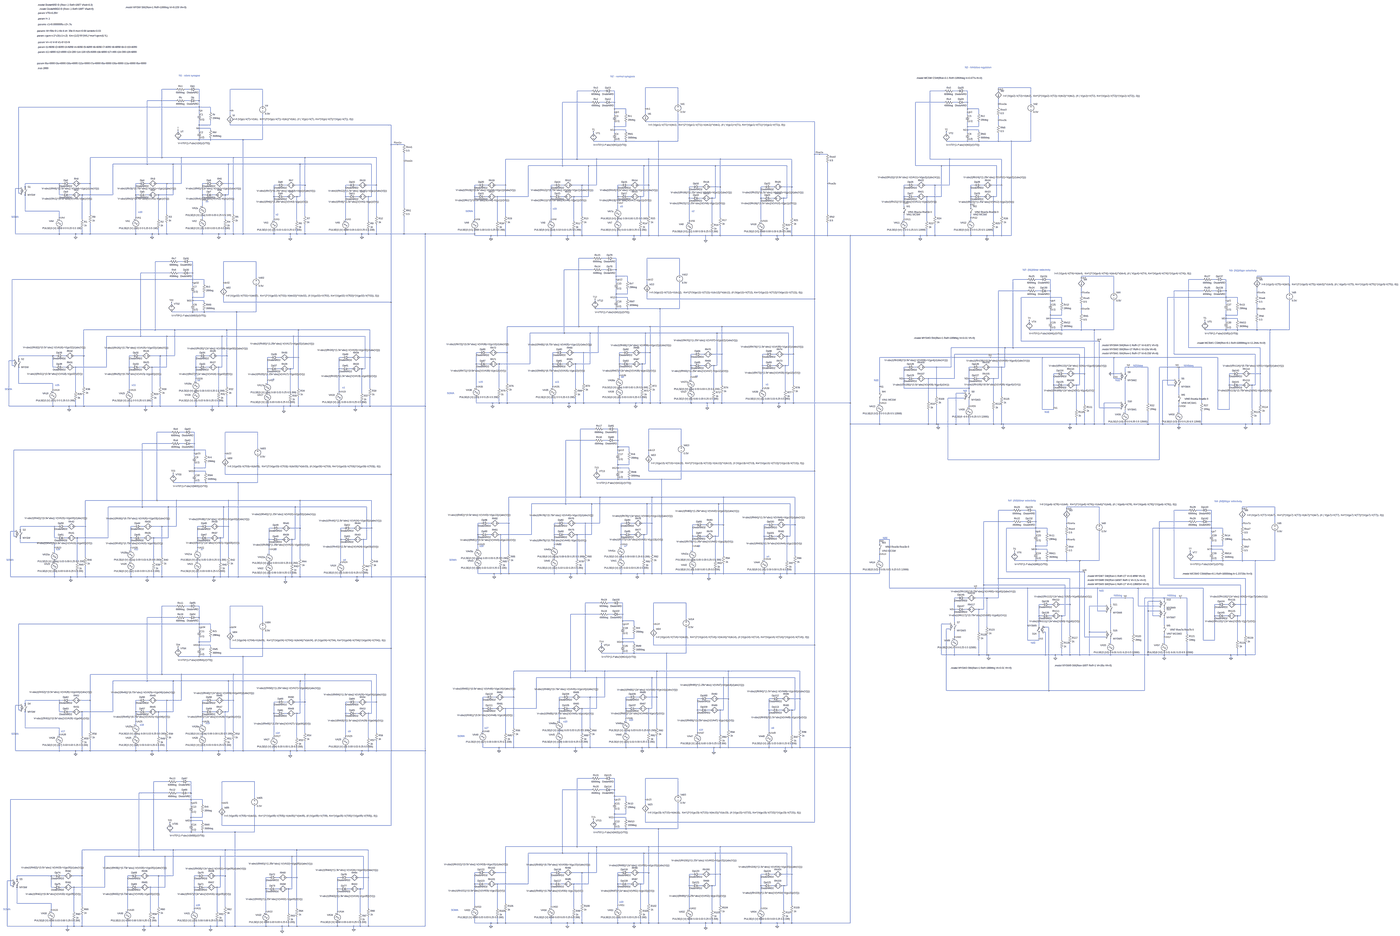
[diagram p0: schematic NC1_240deg_Diamond.asc, whole sheet]
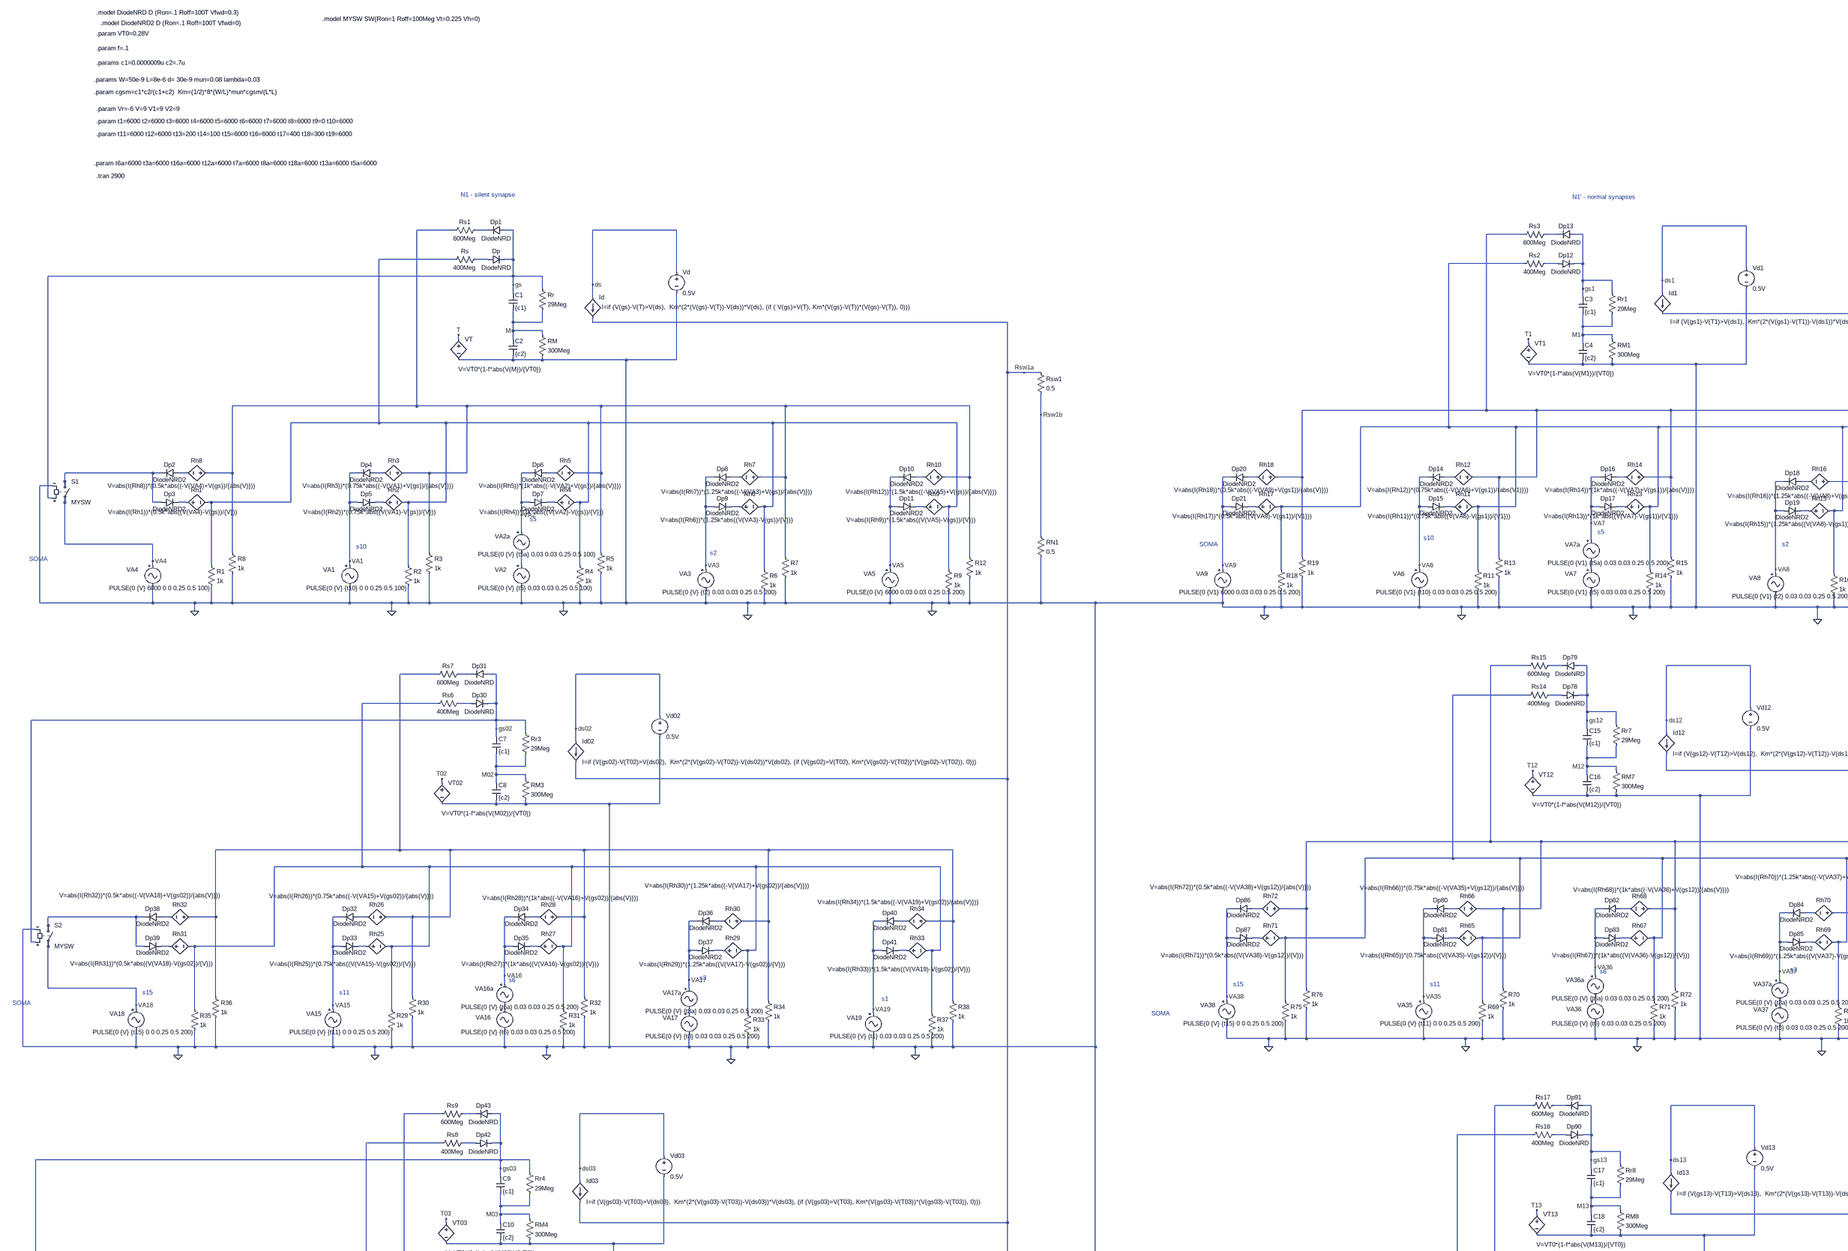
[diagram p1: schematic NC1_240deg_Diamond.asc, part, row 1 of 2, column 1 of 2]
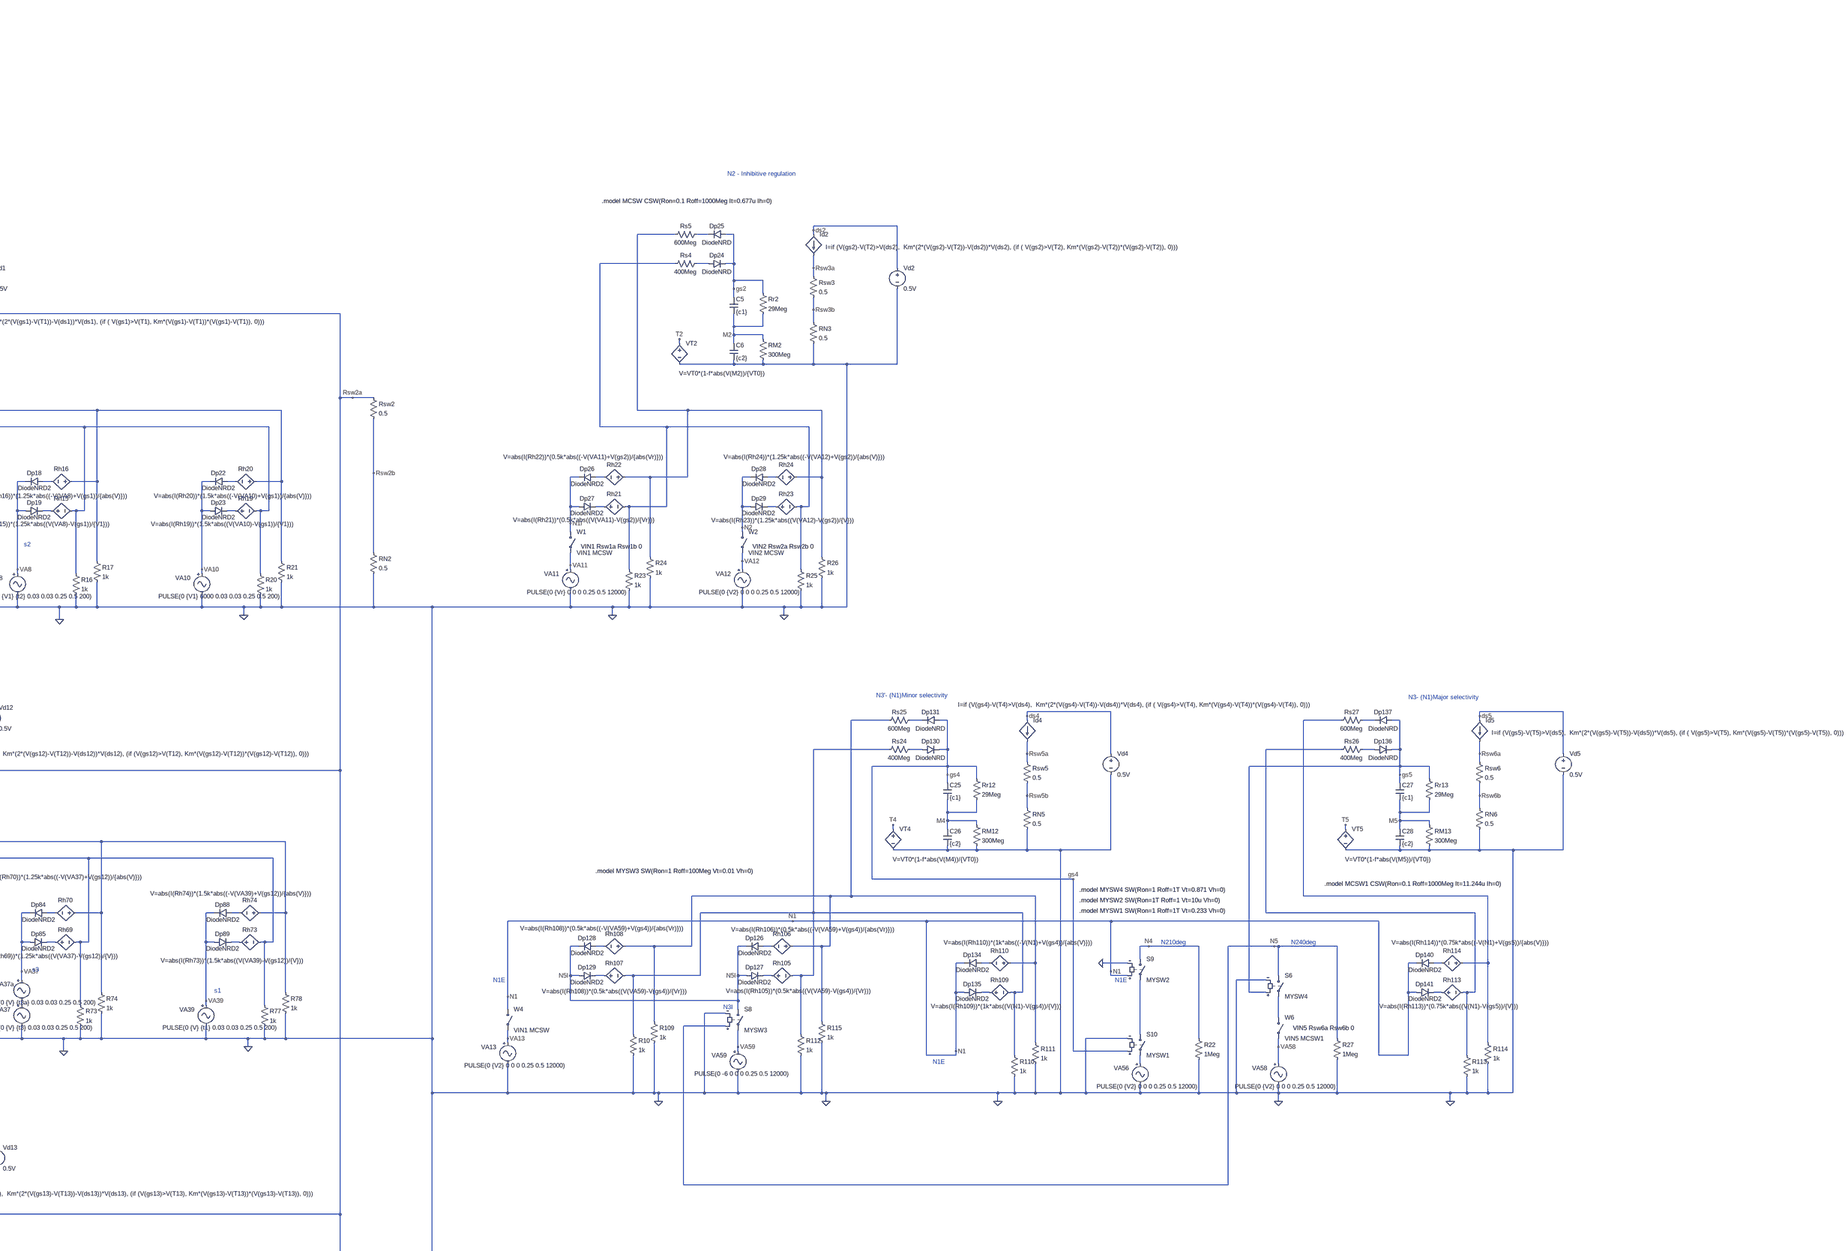
[diagram p2: schematic NC1_240deg_Diamond.asc, part, row 1 of 2, column 2 of 2]
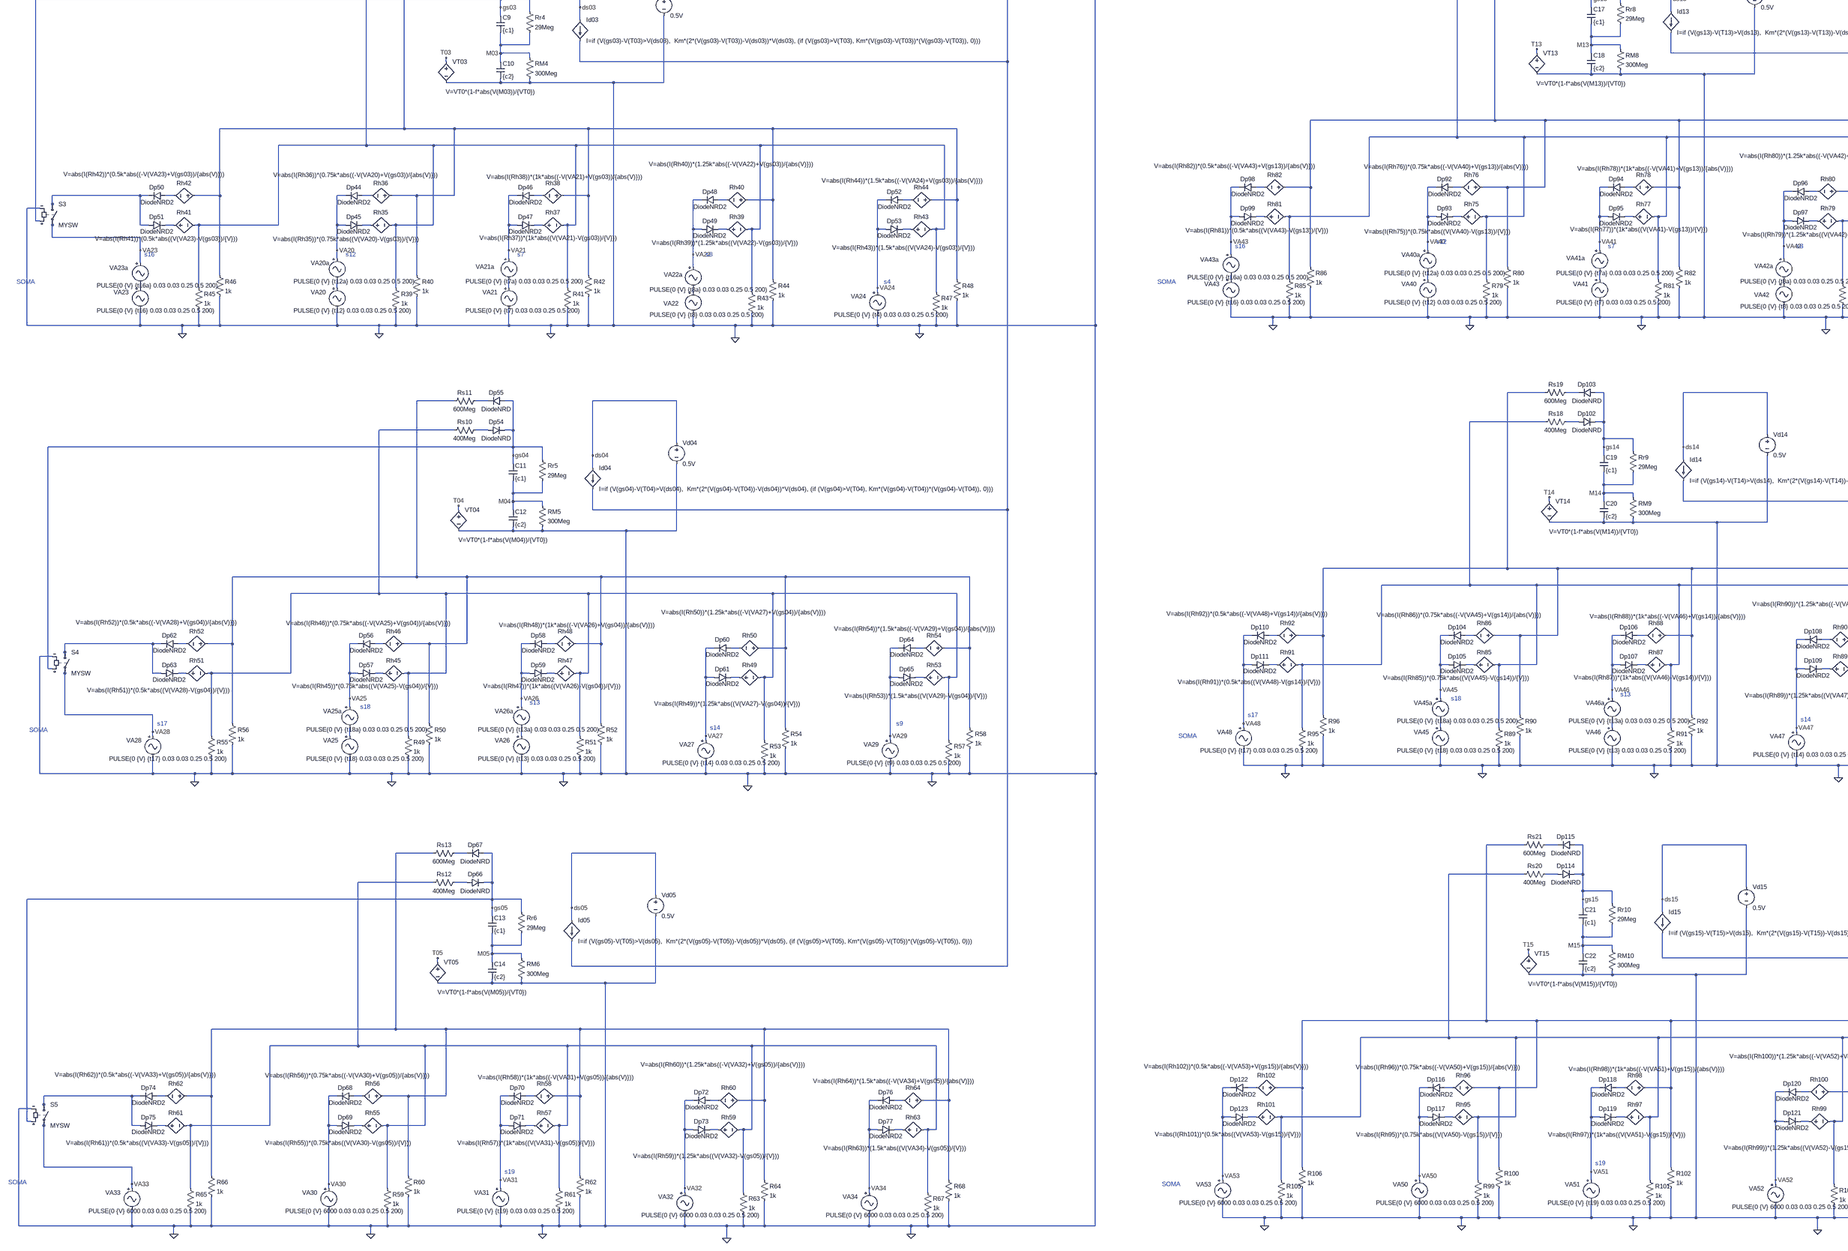
[diagram p3: schematic NC1_240deg_Diamond.asc, part, row 2 of 2, column 1 of 2]
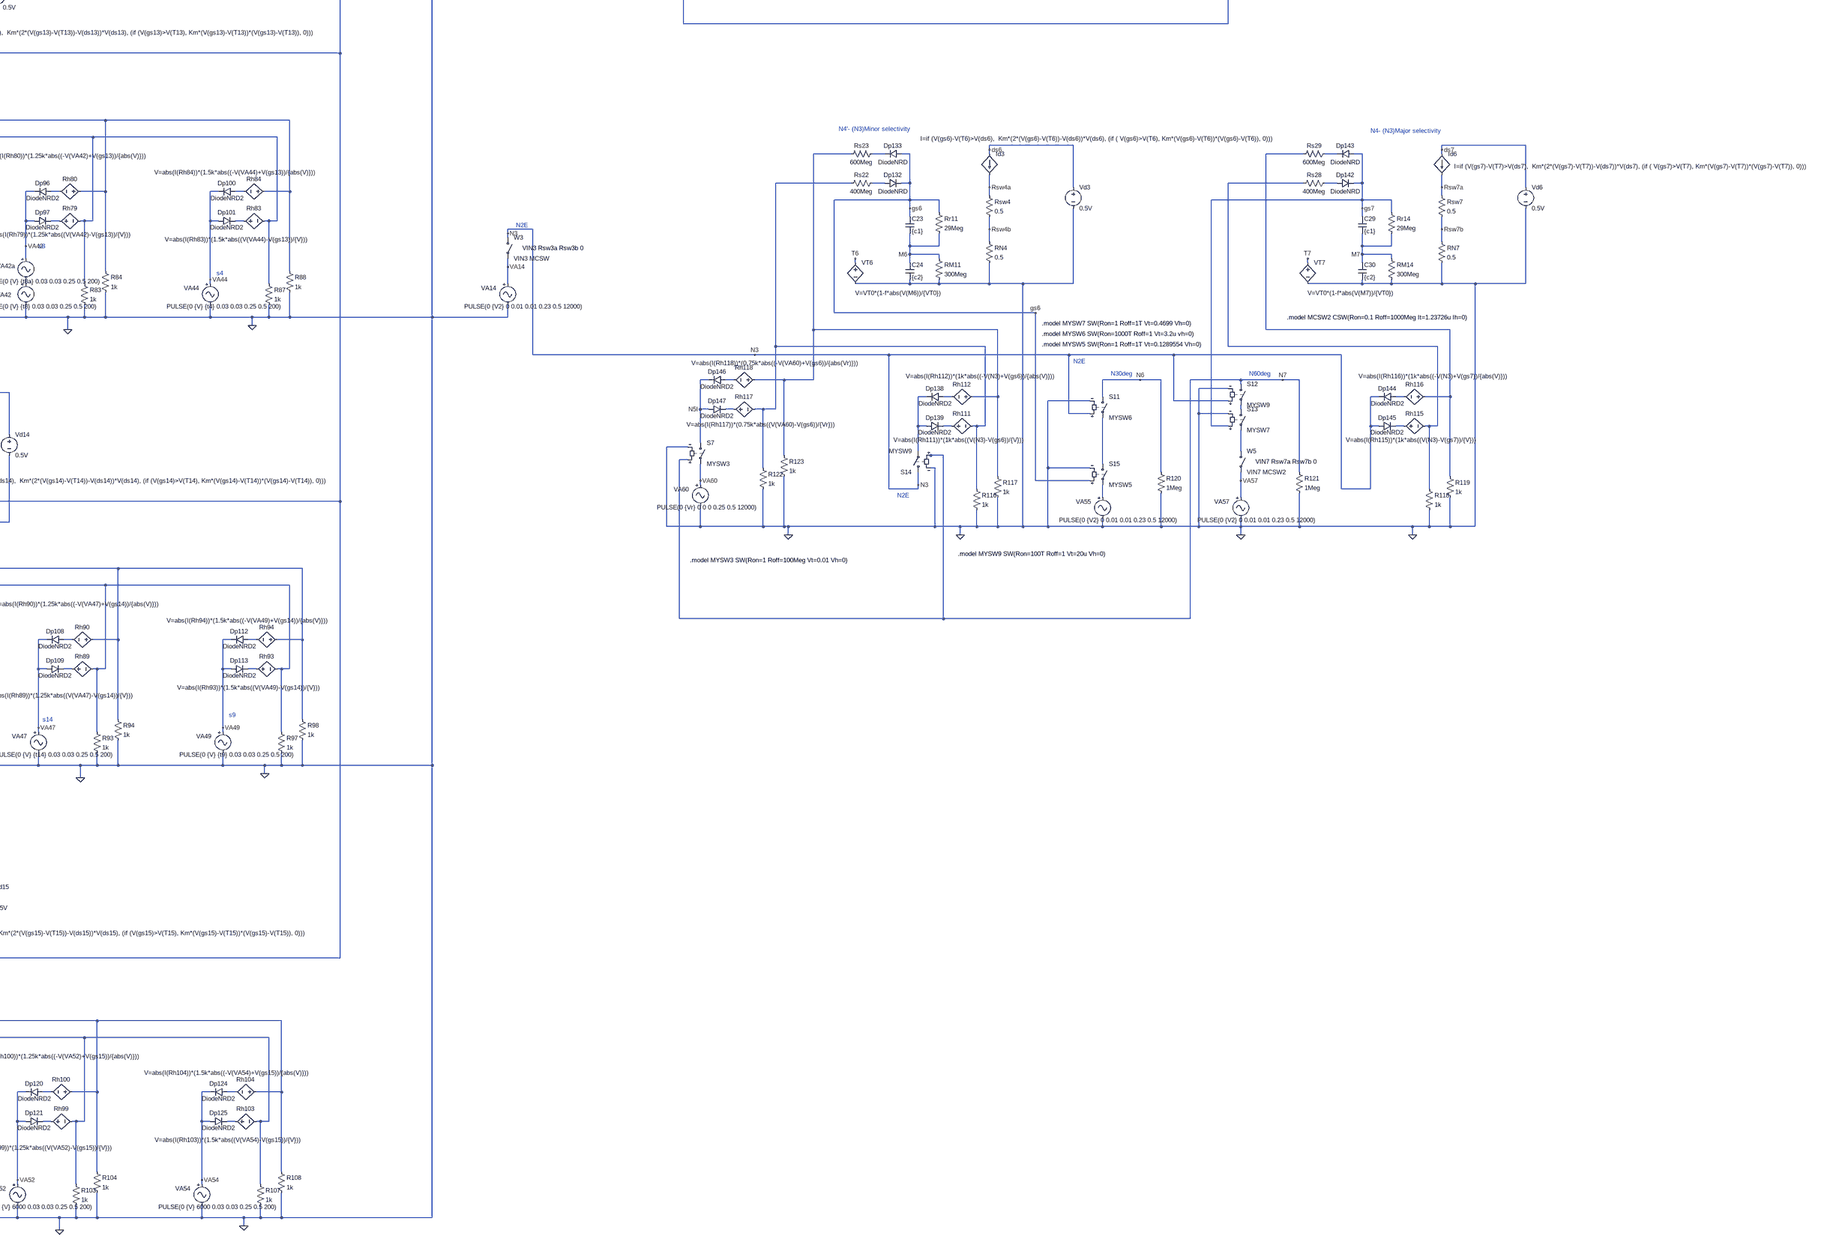
[diagram p4: schematic NC1_240deg_Diamond.asc, part, row 2 of 2, column 2 of 2]
* NC1_240deg_Diamond.asc
Vd ds 0 0.5V
B§Id ds Rsw1a I=if (V(gs)-V(T)>V(ds),  Km*(2*(V(gs)-V(T))-V(ds))*V(ds), (if ( V(gs)>V(T), Km*(V(gs)-V(T))*(V(gs)-V(T)), 0)))
C1 gs M {c1}
C2 M 0 {c2}
Dp N008 gs DiodeNRD
Rs N008 N007 400Meg
Rr gs M 29Meg
RM M 0 300Meg
B§VT T 0 V=VT0*(1-f*abs(V(M))/{VT0})
Dp1 gs N002 DiodeNRD
Rs1 N002 N001 600Meg
VA1 VA1 0 PULSE(0 {V} {t10} 0 0 0.25 0.5 100)
R2 N007 0 1k
B§Rh2 N027 N007 V=abs(I(Rh2))*(0.75k*abs((V(VA1)-V(gs))/{V}))
B§Rh3 N001 N015 V=abs(I(Rh3))*(0.75k*abs((-V(VA1)+V(gs))/{abs(V)}))
Dp4 N015 VA1 DiodeNRD2
Dp5 VA1 N027 DiodeNRD2
R3 N001 0 1k
VA2 N038 0 PULSE(0 {V} {t5} 0.03 0.03 0.25 0.5 100)
R4 N007 0 1k
B§Rh4 N028 N007 V=abs(I(Rh4))*(1k*abs((V(VA2)-V(gs))/{V}))
B§Rh5 N001 N016 V=abs(I(Rh5))*(1k*abs((-V(VA2)+V(gs))/{abs(V)}))
Dp6 N016 VA2 DiodeNRD2
Dp7 VA2 N028 DiodeNRD2
R5 N001 0 1k
VA3 VA3 0 PULSE(0 {V} {t2} 0.03 0.03 0.25 0.5 200)
R6 N007 0 1k
B§Rh6 N029 N007 V=abs(I(Rh6))*(1.25k*abs((V(VA3)-V(gs))/{V}))
B§Rh7 N001 N017 V=abs(I(Rh7))*(1.25k*abs((-V(VA3)+V(gs))/{abs(V)}))
Dp8 N017 VA3 DiodeNRD2
Dp9 VA3 N029 DiodeNRD2
R7 N001 0 1k
VA4 VA4 0 PULSE(0 {V} 6000 0 0 0.25 0.5 100)
R1 N007 0 1k
B§Rh1 N026 N007 V=abs(I(Rh1))*(0.5k*abs((V(VA4)-V(gs))/{V}))
B§Rh8 N001 N014 V=abs(I(Rh8))*(0.5k*abs((-V(VA4)+V(gs))/{abs(V)}))
Dp2 N014 N013 DiodeNRD2
Dp3 N013 N026 DiodeNRD2
R8 N001 0 1k
S1 N013 VA4 gs 0 MYSW
VA5 VA5 0 PULSE(0 {V} 6000 0.03 0.03 0.25 0.5 200)
R9 N007 0 1k
B§Rh9 N030 N007 V=abs(I(Rh9))*(1.5k*abs((V(VA5)-V(gs))/{V}))
B§Rh10 N001 N018 V=abs(I(Rh12))*(1.5k*abs((-V(VA5)+V(gs))/{abs(V)}))
Dp10 N018 VA5 DiodeNRD2
Dp11 VA5 N030 DiodeNRD2
R12 N001 0 1k
Vd1 ds1 0 0.5V
B§Id1 ds1 Rsw2a I=if (V(gs1)-V(T1)>V(ds1),  Km*(2*(V(gs1)-V(T1))-V(ds1))*V(ds1), (if ( V(gs1)>V(T1), Km*(V(gs1)-V(T1))*(V(gs1)-V(T1)), 0)))
C3 gs1 M1 {c1}
C4 M1 0 {c2}
Dp12 N010 gs1 DiodeNRD
Rs2 N010 N009 400Meg
Rr1 gs1 M1 29Meg
RM1 M1 0 300Meg
B§VT1 T1 0 V=VT0*(1-f*abs(V(M1))/{VT0})
Dp13 gs1 N004 DiodeNRD
Rs3 N004 N003 600Meg
VA6 VA6 0 PULSE(0 {V1} {t10} 0.03 0.03 0.25 0.5 200)
R11 N009 0 1k
B§Rh11 N032 N009 V=abs(I(Rh11))*(0.75k*abs((V(VA6)-V(gs1))/{V1}))
B§Rh12 N003 N020 V=abs(I(Rh12))*(0.75k*abs((-V(VA6)+V(gs1))/{abs(V1)}))
Dp14 N020 VA6 DiodeNRD2
Dp15 VA6 N032 DiodeNRD2
R13 N003 0 1k
VA7 N039 0 PULSE(0 {V1} {t5} 0.03 0.03 0.25 0.5 200)
R14 N009 0 1k
B§Rh13 N033 N009 V=abs(I(Rh13))*(1k*abs((V(VA7)-V(gs1))/{V1}))
B§Rh14 N003 N021 V=abs(I(Rh14))*(1k*abs((-V(VA7)+V(gs1))/{abs(V)}))
Dp16 N021 VA7 DiodeNRD2
Dp17 VA7 N033 DiodeNRD2
R15 N003 0 1k
VA8 VA8 0 PULSE(0 {V1} {t2} 0.03 0.03 0.25 0.5 200)
R16 N009 0 1k
B§Rh15 N036 N009 V=abs(I(Rh15))*(1.25k*abs((V(VA8)-V(gs1))/{V1}))
B§Rh16 N003 N024 V=abs(I(Rh16))*(1.25k*abs((-V(VA8)+V(gs1))/{abs(V)}))
Dp18 N024 VA8 DiodeNRD2
Dp19 VA8 N036 DiodeNRD2
R17 N003 0 1k
VA9 VA9 0 PULSE(0 {V1} 6000 0.03 0.03 0.25 0.5 200)
R18 N009 0 1k
B§Rh17 N031 N009 V=abs(I(Rh17))*(0.5k*abs((V(VA9)-V(gs1))/{V1}))
B§Rh18 N003 N019 V=abs(I(Rh18))*(0.5k*abs((-V(VA9)+V(gs1))/{abs(V)}))
Dp20 N019 VA9 DiodeNRD2
Dp21 VA9 N031 DiodeNRD2
R19 N003 0 1k
VA10 VA10 0 PULSE(0 {V1} 6000 0.03 0.03 0.25 0.5 200)
R20 N009 0 1k
B§Rh19 N037 N009 V=abs(I(Rh19))*(1.5k*abs((V(VA10)-V(gs1))/{V1}))
B§Rh20 N003 N025 V=abs(I(Rh20))*(1.5k*abs((-V(VA10)+V(gs1))/{abs(V)}))
Dp22 N025 VA10 DiodeNRD2
Dp23 VA10 N037 DiodeNRD2
R21 N003 0 1k
W2 N2 VA12 VIN2 MCSW
Vd2 ds2 0 0.5V
B§Id2 ds2 Rsw3a I=if (V(gs2)-V(T2)>V(ds2),  Km*(2*(V(gs2)-V(T2))-V(ds2))*V(ds2), (if ( V(gs2)>V(T2), Km*(V(gs2)-V(T2))*(V(gs2)-V(T2)), 0)))
C5 gs2 M2 {c1}
C6 M2 0 {c2}
Dp24 N012 gs2 DiodeNRD
Rs4 N012 N011 400Meg
Rr2 gs2 M2 29Meg
RM2 M2 0 300Meg
B§VT2 T2 0 V=VT0*(1-f*abs(V(M2))/{VT0})
Dp25 gs2 N006 DiodeNRD
Rs5 N006 N005 600Meg
VA11 VA11 0 PULSE(0 {Vr} 0 0 0 0.25 0.5 12000)
R23 N011 0 1k
B§Rh21 N034 N011 V=abs(I(Rh21))*(0.5k*abs((V(VA11)-V(gs2))/{Vr}))
B§Rh22 N005 N022 V=abs(I(Rh22))*(0.5k*abs((-V(VA11)+V(gs2))/{abs(Vr)}))
Dp26 N022 N1I DiodeNRD2
Dp27 N1I N034 DiodeNRD2
R24 N005 0 1k
VA12 VA12 0 PULSE(0 {V2} 0 0 0 0.25 0.5 12000)
R25 N011 0 1k
B§Rh23 N035 N011 V=abs(I(Rh23))*(1.25k*abs((V(VA12)-V(gs2))/{V}))
B§Rh24 N005 N023 V=abs(I(Rh24))*(1.25k*abs((-V(VA12)+V(gs2))/{abs(V)}))
Dp28 N023 N2 DiodeNRD2
Dp29 N2 N035 DiodeNRD2
R26 N005 0 1k
W1 N1I VA11 VIN1 MCSW
W3 N3 VA14 VIN3 MCSW
VA13 VA13 0 PULSE(0 {V2} 0 0 0 0.25 0.5 12000)
Rsw3 Rsw3a Rsw3b 0.5
VA14 VA14 0 PULSE(0 {V2} 0 0.01 0.01 0.23 0.5 12000)
Vd02 ds02 0 0.5V
B§Id02 ds02 Rsw1a I=if (V(gs02)-V(T02)>V(ds02),  Km*(2*(V(gs02)-V(T02))-V(ds02))*V(ds02), (if (V(gs02)>V(T02), Km*(V(gs02)-V(T02))*(V(gs02)-V(T02)), 0)))
C7 gs02 M02 {c1}
C8 M02 0 {c2}
Dp30 N047 gs02 DiodeNRD
Rs6 N047 N046 400Meg
Rr3 gs02 M02 29Meg
RM3 M02 0 300Meg
B§VT02 T02 0 V=VT0*(1-f*abs(V(M02))/{VT0})
Dp31 gs02 N043 DiodeNRD
Rs7 N043 N042 600Meg
VA15 VA15 0 PULSE(0 {V} {t11} 0 0 0.25 0.5 200)
R29 N046 0 1k
B§Rh25 N073 N046 V=abs(I(Rh25))*(0.75k*abs((V(VA15)-V(gs02))/{V}))
B§Rh26 N042 N063 V=abs(I(Rh26))*(0.75k*abs((-V(VA15)+V(gs02))/{abs(V)}))
Dp32 N063 VA15 DiodeNRD2
Dp33 VA15 N073 DiodeNRD2
R30 N042 0 1k
VA16 N087 0 PULSE(0 {V} {t6} 0.03 0.03 0.25 0.5 200)
R31 N046 0 1k
B§Rh27 N074 N046 V=abs(I(Rh27))*(1k*abs((V(VA16)-V(gs02))/{V}))
B§Rh28 N042 N064 V=abs(I(Rh28))*(1k*abs((-V(VA16)+V(gs02))/{abs(V)}))
Dp34 N064 VA16 DiodeNRD2
Dp35 VA16 N074 DiodeNRD2
R32 N042 0 1k
VA17 N088 0 PULSE(0 {V} {t3} 0.03 0.03 0.25 0.5 200)
R33 N046 0 1k
B§Rh29 N077 N046 V=abs(I(Rh29))*(1.25k*abs((V(VA17)-V(gs02))/{V}))
B§Rh30 N042 N065 V=abs(I(Rh30))*(1.25k*abs((-V(VA17)+V(gs02))/{abs(V)}))
Dp36 N065 VA17 DiodeNRD2
Dp37 VA17 N077 DiodeNRD2
R34 N042 0 1k
VA18 VA18 0 PULSE(0 {V} {t15} 0 0 0.25 0.5 200)
R35 N046 0 1k
B§Rh31 N072 N046 V=abs(I(Rh31))*(0.5k*abs((V(VA18)-V(gs02))/{V}))
B§Rh32 N042 N062 V=abs(I(Rh32))*(0.5k*abs((-V(VA18)+V(gs02))/{abs(V)}))
Dp38 N062 N061 DiodeNRD2
Dp39 N061 N072 DiodeNRD2
R36 N042 0 1k
S2 N061 VA18 gs02 0 MYSW
VA19 VA19 0 PULSE(0 {V} {t1} 0.03 0.03 0.25 0.5 200)
R37 N046 0 1k
B§Rh33 N078 N046 V=abs(I(Rh33))*(1.5k*abs((V(VA19)-V(gs02))/{V}))
B§Rh34 N042 N066 V=abs(I(Rh34))*(1.5k*abs((-V(VA19)+V(gs02))/{abs(V)}))
Dp40 N066 VA19 DiodeNRD2
Dp41 VA19 N078 DiodeNRD2
R38 N042 0 1k
Vd03 ds03 0 0.5V
B§Id03 ds03 Rsw1a I=if (V(gs03)-V(T03)>V(ds03),  Km*(2*(V(gs03)-V(T03))-V(ds03))*V(ds03), (if (V(gs03)>V(T03), Km*(V(gs03)-V(T03))*(V(gs03)-V(T03)), 0)))
C9 gs03 M03 {c1}
C10 M03 0 {c2}
Dp42 N099 gs03 DiodeNRD
Rs8 N099 N098 400Meg
Rr4 gs03 M03 29Meg
RM4 M03 0 300Meg
B§VT03 T03 0 V=VT0*(1-f*abs(V(M03))/{VT0})
Dp43 gs03 N095 DiodeNRD
Rs9 N095 N094 600Meg
VA20 N134 0 PULSE(0 {V} {t12} 0.03 0.03 0.25 0.5 200)
R39 N098 0 1k
B§Rh35 N125 N098 V=abs(I(Rh35))*(0.75k*abs((V(VA20)-V(gs03))/{V}))
B§Rh36 N094 N115 V=abs(I(Rh36))*(0.75k*abs((-V(VA20)+V(gs03))/{abs(V)}))
Dp44 N115 VA20 DiodeNRD2
Dp45 VA20 N125 DiodeNRD2
R40 N094 0 1k
VA21 N135 0 PULSE(0 {V} {t7} 0.03 0.03 0.25 0.5 200)
R41 N098 0 1k
B§Rh37 N126 N098 V=abs(I(Rh37))*(1k*abs((V(VA21)-V(gs03))/{V}))
B§Rh38 N094 N116 V=abs(I(Rh38))*(1k*abs((-V(VA21)+V(gs03))/{abs(V)}))
Dp46 N116 VA21 DiodeNRD2
Dp47 VA21 N126 DiodeNRD2
R42 N094 0 1k
VA22 N136 0 PULSE(0 {V} {t8} 0.03 0.03 0.25 0.5 200)
R43 N098 0 1k
B§Rh39 N127 N098 V=abs(I(Rh39))*(1.25k*abs((V(VA22)-V(gs03))/{V}))
B§Rh40 N094 N117 V=abs(I(Rh40))*(1.25k*abs((-V(VA22)+V(gs03))/{abs(V)}))
Dp48 N117 VA22 DiodeNRD2
Dp49 VA22 N127 DiodeNRD2
R44 N094 0 1k
VA23 N133 0 PULSE(0 {V} {t16} 0.03 0.03 0.25 0.5 200)
R45 N098 0 1k
B§Rh41 N124 N098 V=abs(I(Rh41))*(0.5k*abs((V(VA23)-V(gs03))/{V}))
B§Rh42 N094 N114 V=abs(I(Rh42))*(0.5k*abs((-V(VA23)+V(gs03))/{abs(V)}))
Dp50 N114 N113 DiodeNRD2
Dp51 N113 N124 DiodeNRD2
R46 N094 0 1k
S3 N113 VA23 gs03 0 MYSW
VA24 VA24 0 PULSE(0 {V} {t4} 0.03 0.03 0.25 0.5 200)
R47 N098 0 1k
B§Rh43 N128 N098 V=abs(I(Rh43))*(1.5k*abs((V(VA24)-V(gs03))/{V}))
B§Rh44 N094 N118 V=abs(I(Rh44))*(1.5k*abs((-V(VA24)+V(gs03))/{abs(V)}))
Dp52 N118 VA24 DiodeNRD2
Dp53 VA24 N128 DiodeNRD2
R48 N094 0 1k
Vd04 ds04 0 0.5V
B§Id04 ds04 Rsw1a I=if (V(gs04)-V(T04)>V(ds04),  Km*(2*(V(gs04)-V(T04))-V(ds04))*V(ds04), (if (V(gs04)>V(T04), Km*(V(gs04)-V(T04))*(V(gs04)-V(T04)), 0)))
C11 gs04 M04 {c1}
C12 M04 0 {c2}
Dp54 N152 gs04 DiodeNRD
Rs10 N152 N151 400Meg
Rr5 gs04 M04 29Meg
RM5 M04 0 300Meg
B§VT04 T04 0 V=VT0*(1-f*abs(V(M04))/{VT0})
Dp55 gs04 N144 DiodeNRD
Rs11 N144 N143 600Meg
VA25 N179 0 PULSE(0 {V} {t18} 0.03 0.03 0.25 0.5 200)
R49 N151 0 1k
B§Rh45 N173 N151 V=abs(I(Rh45))*(0.75k*abs((V(VA25)-V(gs04))/{V}))
B§Rh46 N143 N163 V=abs(I(Rh46))*(0.75k*abs((-V(VA25)+V(gs04))/{abs(V)}))
Dp56 N163 VA25 DiodeNRD2
Dp57 VA25 N173 DiodeNRD2
R50 N143 0 1k
VA26 N180 0 PULSE(0 {V} {t13} 0.03 0.03 0.25 0.5 200)
R51 N151 0 1k
B§Rh47 N174 N151 V=abs(I(Rh47))*(1k*abs((V(VA26)-V(gs04))/{V}))
B§Rh48 N143 N164 V=abs(I(Rh48))*(1k*abs((-V(VA26)+V(gs04))/{abs(V)}))
Dp58 N164 VA26 DiodeNRD2
Dp59 VA26 N174 DiodeNRD2
R52 N143 0 1k
VA27 VA27 0 PULSE(0 {V} {t14} 0.03 0.03 0.25 0.5 200)
R53 N151 0 1k
B§Rh49 N175 N151 V=abs(I(Rh49))*(1.25k*abs((V(VA27)-V(gs04))/{V}))
B§Rh50 N143 N165 V=abs(I(Rh50))*(1.25k*abs((-V(VA27)+V(gs04))/{abs(V)}))
Dp60 N165 VA27 DiodeNRD2
Dp61 VA27 N175 DiodeNRD2
R54 N143 0 1k
VA28 VA28 0 PULSE(0 {V} {t17} 0.03 0.03 0.25 0.5 200)
R55 N151 0 1k
B§Rh51 N172 N151 V=abs(I(Rh51))*(0.5k*abs((V(VA28)-V(gs04))/{V}))
B§Rh52 N143 N162 V=abs(I(Rh52))*(0.5k*abs((-V(VA28)+V(gs04))/{abs(V)}))
Dp62 N162 N161 DiodeNRD2
Dp63 N161 N172 DiodeNRD2
R56 N143 0 1k
S4 N161 VA28 gs04 0 MYSW
VA29 VA29 0 PULSE(0 {V} {t9} 0.03 0.03 0.25 0.5 200)
R57 N151 0 1k
B§Rh53 N176 N151 V=abs(I(Rh53))*(1.5k*abs((V(VA29)-V(gs04))/{V}))
B§Rh54 N143 N166 V=abs(I(Rh54))*(1.5k*abs((-V(VA29)+V(gs04))/{abs(V)}))
Dp64 N166 VA29 DiodeNRD2
Dp65 VA29 N176 DiodeNRD2
R58 N143 0 1k
Vd05 ds05 0 0.5V
B§Id05 ds05 Rsw1a I=if (V(gs05)-V(T05)>V(ds05),  Km*(2*(V(gs05)-V(T05))-V(ds05))*V(ds05), (if (V(gs05)>V(T05), Km*(V(gs05)-V(T05))*(V(gs05)-V(T05)), 0)))
C13 gs05 M05 {c1}
C14 M05 0 {c2}
Dp66 N188 gs05 DiodeNRD
Rs12 N188 N187 400Meg
Rr6 gs05 M05 29Meg
RM6 M05 0 300Meg
B§VT05 T05 0 V=VT0*(1-f*abs(V(M05))/{VT0})
Dp67 gs05 N184 DiodeNRD
Rs13 N184 N183 600Meg
VA30 VA30 0 PULSE(0 {V} 6000 0.03 0.03 0.25 0.5 200)
R59 N187 0 1k
B§Rh55 N206 N187 V=abs(I(Rh55))*(0.75k*abs((V(VA30)-V(gs05))/{V}))
B§Rh56 N183 N196 V=abs(I(Rh56))*(0.75k*abs((-V(VA30)+V(gs05))/{abs(V)}))
Dp68 N196 VA30 DiodeNRD2
Dp69 VA30 N206 DiodeNRD2
R60 N183 0 1k
VA31 VA31 0 PULSE(0 {V} {t19} 0.03 0.03 0.25 0.5 200)
R61 N187 0 1k
B§Rh57 N207 N187 V=abs(I(Rh57))*(1k*abs((V(VA31)-V(gs05))/{V}))
B§Rh58 N183 N197 V=abs(I(Rh58))*(1k*abs((-V(VA31)+V(gs05))/{abs(V)}))
Dp70 N197 VA31 DiodeNRD2
Dp71 VA31 N207 DiodeNRD2
R62 N183 0 1k
VA32 VA32 0 PULSE(0 {V} 6000 0.03 0.03 0.25 0.5 200)
R63 N187 0 1k
B§Rh59 N208 N187 V=abs(I(Rh59))*(1.25k*abs((V(VA32)-V(gs05))/{V}))
B§Rh60 N183 N198 V=abs(I(Rh60))*(1.25k*abs((-V(VA32)+V(gs05))/{abs(V)}))
Dp72 N198 VA32 DiodeNRD2
Dp73 VA32 N208 DiodeNRD2
R64 N183 0 1k
VA33 VA33 0 PULSE(0 {V} 6000 0.03 0.03 0.25 0.5 200)
R65 N187 0 1k
B§Rh61 N205 N187 V=abs(I(Rh61))*(0.5k*abs((V(VA33)-V(gs05))/{V}))
B§Rh62 N183 N195 V=abs(I(Rh62))*(0.5k*abs((-V(VA33)+V(gs05))/{abs(V)}))
Dp74 N195 N194 DiodeNRD2
Dp75 N194 N205 DiodeNRD2
R66 N183 0 1k
S5 N194 VA33 gs05 0 MYSW
VA34 VA34 0 PULSE(0 {V} 6000 0.03 0.03 0.25 0.5 200)
R67 N187 0 1k
B§Rh63 N209 N187 V=abs(I(Rh63))*(1.5k*abs((V(VA34)-V(gs05))/{V}))
B§Rh64 N183 N199 V=abs(I(Rh64))*(1.5k*abs((-V(VA34)+V(gs05))/{abs(V)}))
Dp76 N199 VA34 DiodeNRD2
Dp77 VA34 N209 DiodeNRD2
R68 N183 0 1k
VA16a VA16 N087 PULSE(0 {V} {t6a} 0.03 0.03 0.25 0.5 200)
VA21a VA21 N135 PULSE(0 {V} {t7a} 0.03 0.03 0.25 0.5 200)
VA26a VA26 N180 PULSE(0 {V} {t13a} 0.03 0.03 0.25 0.5 200)
VA25a VA25 N179 PULSE(0 {V} {t18a} 0.03 0.03 0.25 0.5 200)
VA23a VA23 N133 PULSE(0 {V} {t16a} 0.03 0.03 0.25 0.5 200)
VA22a VA22 N136 PULSE(0 {V} {t8a} 0.03 0.03 0.25 0.5 200)
VA17a VA17 N088 PULSE(0 {V} {t3a} 0.03 0.03 0.25 0.5 200)
Vd12 ds12 0 0.5V
B§Id12 ds12 Rsw2a I=if (V(gs12)-V(T12)>V(ds12),  Km*(2*(V(gs12)-V(T12))-V(ds12))*V(ds12), (if (V(gs12)>V(T12), Km*(V(gs12)-V(T12))*(V(gs12)-V(T12)), 0)))
C15 gs12 M12 {c1}
C16 M12 0 {c2}
Dp78 N045 gs12 DiodeNRD
Rs14 N045 N044 400Meg
Rr7 gs12 M12 29Meg
RM7 M12 0 300Meg
B§VT12 T12 0 V=VT0*(1-f*abs(V(M12))/{VT0})
Dp79 gs12 N041 DiodeNRD
Rs15 N041 N040 600Meg
VA35 VA35 0 PULSE(0 {V} {t11} 0 0 0.25 0.5 200)
R69 N044 0 1k
B§Rh65 N068 N044 V=abs(I(Rh65))*(0.75k*abs((V(VA35)-V(gs12))/{V}))
B§Rh66 N040 N057 V=abs(I(Rh66))*(0.75k*abs((-V(VA35)+V(gs12))/{abs(V)}))
Dp80 N057 VA35 DiodeNRD2
Dp81 VA35 N068 DiodeNRD2
R70 N040 0 1k
VA36 N085 0 PULSE(0 {V} {t6} 0.03 0.03 0.25 0.5 200)
R71 N044 0 1k
B§Rh67 N069 N044 V=abs(I(Rh67))*(1k*abs((V(VA36)-V(gs12))/{V}))
B§Rh68 N040 N058 V=abs(I(Rh68))*(1k*abs((-V(VA36)+V(gs12))/{abs(V)}))
Dp82 N058 VA36 DiodeNRD2
Dp83 VA36 N069 DiodeNRD2
R72 N040 0 1k
VA37 N086 0 PULSE(0 {V} {t3} 0.03 0.03 0.25 0.5 200)
R73 N044 0 1k
B§Rh69 N070 N044 V=abs(I(Rh69))*(1.25k*abs((V(VA37)-V(gs12))/{V}))
B§Rh70 N040 N059 V=abs(I(Rh70))*(1.25k*abs((-V(VA37)+V(gs12))/{abs(V)}))
Dp84 N059 VA37 DiodeNRD2
Dp85 VA37 N070 DiodeNRD2
R74 N040 0 1k
VA38 VA38 0 PULSE(0 {V} {t15} 0 0 0.25 0.5 200)
R75 N044 0 1k
B§Rh71 N067 N044 V=abs(I(Rh71))*(0.5k*abs((V(VA38)-V(gs12))/{V}))
B§Rh72 N040 N056 V=abs(I(Rh72))*(0.5k*abs((-V(VA38)+V(gs12))/{abs(V)}))
Dp86 N056 VA38 DiodeNRD2
Dp87 VA38 N067 DiodeNRD2
R76 N040 0 1k
VA39 VA39 0 PULSE(0 {V} {t1} 0.03 0.03 0.25 0.5 200)
R77 N044 0 1k
B§Rh73 N071 N044 V=abs(I(Rh73))*(1.5k*abs((V(VA39)-V(gs12))/{V}))
B§Rh74 N040 N060 V=abs(I(Rh74))*(1.5k*abs((-V(VA39)+V(gs12))/{abs(V)}))
Dp88 N060 VA39 DiodeNRD2
Dp89 VA39 N071 DiodeNRD2
R78 N040 0 1k
Vd13 ds13 0 0.5V
B§Id13 ds13 Rsw2a I=if (V(gs13)-V(T13)>V(ds13),  Km*(2*(V(gs13)-V(T13))-V(ds13))*V(ds13), (if (V(gs13)>V(T13), Km*(V(gs13)-V(T13))*(V(gs13)-V(T13)), 0)))
C17 gs13 M13 {c1}
C18 M13 0 {c2}
Dp90 N097 gs13 DiodeNRD
Rs16 N097 N096 400Meg
Rr8 gs13 M13 29Meg
RM8 M13 0 300Meg
B§VT13 T13 0 V=VT0*(1-f*abs(V(M13))/{VT0})
Dp91 gs13 N093 DiodeNRD
Rs17 N093 N092 600Meg
VA40 N130 0 PULSE(0 {V} {t12} 0.03 0.03 0.25 0.5 200)
R79 N096 0 1k
B§Rh75 N120 N096 V=abs(I(Rh75))*(0.75k*abs((V(VA40)-V(gs13))/{V}))
B§Rh76 N092 N109 V=abs(I(Rh76))*(0.75k*abs((-V(VA40)+V(gs13))/{abs(V)}))
Dp92 N109 VA40 DiodeNRD2
Dp93 VA40 N120 DiodeNRD2
R80 N092 0 1k
VA41 N131 0 PULSE(0 {V} {t7} 0.03 0.03 0.25 0.5 200)
R81 N096 0 1k
B§Rh77 N121 N096 V=abs(I(Rh77))*(1k*abs((V(VA41)-V(gs13))/{V}))
B§Rh78 N092 N110 V=abs(I(Rh78))*(1k*abs((-V(VA41)+V(gs13))/{abs(V)}))
Dp94 N110 VA41 DiodeNRD2
Dp95 VA41 N121 DiodeNRD2
R82 N092 0 1k
VA42 N132 0 PULSE(0 {V} {t8} 0.03 0.03 0.25 0.5 200)
R83 N096 0 1k
B§Rh79 N122 N096 V=abs(I(Rh79))*(1.25k*abs((V(VA42)-V(gs13))/{V}))
B§Rh80 N092 N111 V=abs(I(Rh80))*(1.25k*abs((-V(VA42)+V(gs13))/{abs(V)}))
Dp96 N111 VA42 DiodeNRD2
Dp97 VA42 N122 DiodeNRD2
R84 N092 0 1k
VA43 N129 0 PULSE(0 {V} {t16} 0.03 0.03 0.25 0.5 200)
R85 N096 0 1k
B§Rh81 N119 N096 V=abs(I(Rh81))*(0.5k*abs((V(VA43)-V(gs13))/{V}))
B§Rh82 N092 N108 V=abs(I(Rh82))*(0.5k*abs((-V(VA43)+V(gs13))/{abs(V)}))
Dp98 N108 VA43 DiodeNRD2
Dp99 VA43 N119 DiodeNRD2
R86 N092 0 1k
VA44 VA44 0 PULSE(0 {V} {t4} 0.03 0.03 0.25 0.5 200)
R87 N096 0 1k
B§Rh83 N123 N096 V=abs(I(Rh83))*(1.5k*abs((V(VA44)-V(gs13))/{V}))
B§Rh84 N092 N112 V=abs(I(Rh84))*(1.5k*abs((-V(VA44)+V(gs13))/{abs(V)}))
Dp100 N112 VA44 DiodeNRD2
Dp101 VA44 N123 DiodeNRD2
R88 N092 0 1k
Vd14 ds14 0 0.5V
B§Id14 ds14 Rsw2a I=if (V(gs14)-V(T14)>V(ds14),  Km*(2*(V(gs14)-V(T14))-V(ds14))*V(ds14), (if (V(gs14)>V(T14), Km*(V(gs14)-V(T14))*(V(gs14)-V(T14)), 0)))
C19 gs14 M14 {c1}
C20 M14 0 {c2}
Dp102 N148 gs14 DiodeNRD
Rs18 N148 N147 400Meg
Rr9 gs14 M14 29Meg
RM9 M14 0 300Meg
B§VT14 T14 0 V=VT0*(1-f*abs(V(M14))/{VT0})
Dp103 gs14 N139 DiodeNRD
Rs19 N139 N138 600Meg
VA45 N177 0 PULSE(0 {V} {t18} 0.03 0.03 0.25 0.5 200)
R89 N147 0 1k
B§Rh85 N168 N147 V=abs(I(Rh85))*(0.75k*abs((V(VA45)-V(gs14))/{V}))
B§Rh86 N138 N157 V=abs(I(Rh86))*(0.75k*abs((-V(VA45)+V(gs14))/{abs(V)}))
Dp104 N157 VA45 DiodeNRD2
Dp105 VA45 N168 DiodeNRD2
R90 N138 0 1k
VA46 N178 0 PULSE(0 {V} {t13} 0.03 0.03 0.25 0.5 200)
R91 N147 0 1k
B§Rh87 N169 N147 V=abs(I(Rh87))*(1k*abs((V(VA46)-V(gs14))/{V}))
B§Rh88 N138 N158 V=abs(I(Rh88))*(1k*abs((-V(VA46)+V(gs14))/{abs(V)}))
Dp106 N158 VA46 DiodeNRD2
Dp107 VA46 N169 DiodeNRD2
R92 N138 0 1k
VA47 VA47 0 PULSE(0 {V} {t14} 0.03 0.03 0.25 0.5 200)
R93 N147 0 1k
B§Rh89 N170 N147 V=abs(I(Rh89))*(1.25k*abs((V(VA47)-V(gs14))/{V}))
B§Rh90 N138 N159 V=abs(I(Rh90))*(1.25k*abs((-V(VA47)+V(gs14))/{abs(V)}))
Dp108 N159 VA47 DiodeNRD2
Dp109 VA47 N170 DiodeNRD2
R94 N138 0 1k
VA48 VA48 0 PULSE(0 {V} {t17} 0.03 0.03 0.25 0.5 200)
R95 N147 0 1k
B§Rh91 N167 N147 V=abs(I(Rh91))*(0.5k*abs((V(VA48)-V(gs14))/{V}))
B§Rh92 N138 N156 V=abs(I(Rh92))*(0.5k*abs((-V(VA48)+V(gs14))/{abs(V)}))
Dp110 N156 VA48 DiodeNRD2
Dp111 VA48 N167 DiodeNRD2
R96 N138 0 1k
VA49 VA49 0 PULSE(0 {V} {t9} 0.03 0.03 0.25 0.5 200)
R97 N147 0 1k
B§Rh93 N171 N147 V=abs(I(Rh93))*(1.5k*abs((V(VA49)-V(gs14))/{V}))
B§Rh94 N138 N160 V=abs(I(Rh94))*(1.5k*abs((-V(VA49)+V(gs14))/{abs(V)}))
Dp112 N160 VA49 DiodeNRD2
Dp113 VA49 N171 DiodeNRD2
R98 N138 0 1k
Vd15 ds15 0 0.5V
B§Id15 ds15 Rsw2a I=if (V(gs15)-V(T15)>V(ds15),  Km*(2*(V(gs15)-V(T15))-V(ds15))*V(ds15), (if (V(gs15)>V(T15), Km*(V(gs15)-V(T15))*(V(gs15)-V(T15)), 0)))
C21 gs15 M15 {c1}
C22 M15 0 {c2}
Dp114 N186 gs15 DiodeNRD
Rs20 N186 N185 400Meg
Rr10 gs15 M15 29Meg
RM10 M15 0 300Meg
B§VT15 T15 0 V=VT0*(1-f*abs(V(M15))/{VT0})
Dp115 gs15 N182 DiodeNRD
Rs21 N182 N181 600Meg
VA50 VA50 0 PULSE(0 {V} 6000 0.03 0.03 0.25 0.5 200)
R99 N185 0 1k
B§Rh95 N201 N185 V=abs(I(Rh95))*(0.75k*abs((V(VA50)-V(gs15))/{V}))
B§Rh96 N181 N190 V=abs(I(Rh96))*(0.75k*abs((-V(VA50)+V(gs15))/{abs(V)}))
Dp116 N190 VA50 DiodeNRD2
Dp117 VA50 N201 DiodeNRD2
R100 N181 0 1k
VA51 VA51 0 PULSE(0 {V} {t19} 0.03 0.03 0.25 0.5 200)
R101 N185 0 1k
B§Rh97 N202 N185 V=abs(I(Rh97))*(1k*abs((V(VA51)-V(gs15))/{V}))
B§Rh98 N181 N191 V=abs(I(Rh98))*(1k*abs((-V(VA51)+V(gs15))/{abs(V)}))
Dp118 N191 VA51 DiodeNRD2
Dp119 VA51 N202 DiodeNRD2
R102 N181 0 1k
VA52 VA52 0 PULSE(0 {V} 6000 0.03 0.03 0.25 0.5 200)
R103 N185 0 1k
B§Rh99 N203 N185 V=abs(I(Rh99))*(1.25k*abs((V(VA52)-V(gs15))/{V}))
B§Rh100 N181 N192 V=abs(I(Rh100))*(1.25k*abs((-V(VA52)+V(gs15))/{abs(V)}))
Dp120 N192 VA52 DiodeNRD2
Dp121 VA52 N203 DiodeNRD2
R104 N181 0 1k
VA53 VA53 0 PULSE(0 {V} 6000 0.03 0.03 0.25 0.5 200)
R105 N185 0 1k
B§Rh101 N200 N185 V=abs(I(Rh101))*(0.5k*abs((V(VA53)-V(gs15))/{V}))
B§Rh102 N181 N189 V=abs(I(Rh102))*(0.5k*abs((-V(VA53)+V(gs15))/{abs(V)}))
Dp122 N189 VA53 DiodeNRD2
Dp123 VA53 N200 DiodeNRD2
R106 N181 0 1k
VA54 VA54 0 PULSE(0 {V} 6000 0.03 0.03 0.25 0.5 200)
R107 N185 0 1k
B§Rh103 N204 N185 V=abs(I(Rh103))*(1.5k*abs((V(VA54)-V(gs15))/{V}))
B§Rh104 N181 N193 V=abs(I(Rh104))*(1.5k*abs((-V(VA54)+V(gs15))/{abs(V)}))
Dp124 N193 VA54 DiodeNRD2
Dp125 VA54 N204 DiodeNRD2
R108 N181 0 1k
VA36a VA36 N085 PULSE(0 {V} {t6a} 0.03 0.03 0.25 0.5 200)
VA41a VA41 N131 PULSE(0 {V} {t7a} 0.03 0.03 0.25 0.5 200)
VA46a VA46 N178 PULSE(0 {V} {t13a} 0.03 0.03 0.25 0.5 200)
VA45a VA45 N177 PULSE(0 {V} {t18a} 0.03 0.03 0.25 0.5 200)
VA43a VA43 N129 PULSE(0 {V} {t16a} 0.03 0.03 0.25 0.5 200)
VA42a VA42 N132 PULSE(0 {V} {t8a} 0.03 0.03 0.25 0.5 200)
VA37a VA37 N086 PULSE(0 {V} {t3a} 0.03 0.03 0.25 0.5 200)
W4 N1 VA13 VIN1 MCSW
Rsw1 Rsw1a Rsw1b 0.5
Rsw2 Rsw2a Rsw2b 0.5
VA20a VA20 N134 PULSE(0 {V} {t12a} 0.03 0.03 0.25 0.5 200)
VA40a VA40 N130 PULSE(0 {V} {t12a} 0.03 0.03 0.25 0.5 200)
RN1 Rsw1b 0 0.5
RN2 Rsw2b 0 0.5
RN3 Rsw3b 0 0.5
Vd4 ds4 0 0.5V
B§Id4 ds4 Rsw5a I=if (V(gs4)-V(T4)>V(ds4),  Km*(2*(V(gs4)-V(T4))-V(ds4))*V(ds4), (if ( V(gs4)>V(T4), Km*(V(gs4)-V(T4))*(V(gs4)-V(T4)), 0)))
C25 gs4 M4 {c1}
C26 M4 0 {c2}
Dp130 N053 gs4 DiodeNRD
Rs24 N053 N052 400Meg
Rr12 gs4 M4 29Meg
RM12 M4 0 300Meg
B§VT4 T4 0 V=VT0*(1-f*abs(V(M4))/{VT0})
Dp131 gs4 N049 DiodeNRD
Rs25 N049 N048 600Meg
R110 N052 0 1k
B§Rh109 N083 N052 V=abs(I(Rh109))*(1k*abs((V(N1)-V(gs4))/{V}))
B§Rh110 N048 N079 V=abs(I(Rh110))*(1k*abs((-V(N1)+V(gs4))/{abs(V)}))
Dp134 N079 N1 DiodeNRD2
Dp135 N1 N083 DiodeNRD2
R111 N048 0 1k
Rsw5 Rsw5a Rsw5b 0.5
RN5 Rsw5b 0 0.5
Vd5 ds5 0 0.5V
B§Id5 ds5 Rsw6a I=if (V(gs5)-V(T5)>V(ds5),  Km*(2*(V(gs5)-V(T5))-V(ds5))*V(ds5), (if ( V(gs5)>V(T5), Km*(V(gs5)-V(T5))*(V(gs5)-V(T5)), 0)))
C27 gs5 M5 {c1}
C28 M5 0 {c2}
Dp136 N055 gs5 DiodeNRD
Rs26 N055 N054 400Meg
Rr13 gs5 M5 29Meg
RM13 M5 0 300Meg
B§VT5 T5 0 V=VT0*(1-f*abs(V(M5))/{VT0})
Dp137 gs5 N051 DiodeNRD
Rs27 N051 N050 600Meg
R113 N054 0 1k
B§Rh113 N084 N054 V=abs(I(Rh113))*(0.75k*abs((V(N1)-V(gs5))/{V}))
B§Rh114 N050 N080 V=abs(I(Rh114))*(0.75k*abs((-V(N1)+V(gs5))/{abs(V)}))
Dp140 N080 N1 DiodeNRD2
Dp141 N1 N084 DiodeNRD2
R114 N050 0 1k
Rsw6 Rsw6a Rsw6b 0.5
RN6 Rsw6b 0 0.5
VA56 N091 0 PULSE(0 {V2} 0 0 0 0.25 0.5 12000)
R22 N4 0 1Meg
W6 N089 VA58 VIN5 MCSW1
VA58 VA58 0 PULSE(0 {V2} 0 0 0 0.25 0.5 12000)
R27 N5 0 1Meg
VA59 VA59 0 PULSE(0 -6 0 0 0 0.25 0.5 12000)
B§Rh105 N082 N052 V=abs(I(Rh105))*(0.5k*abs((V(VA59)-V(gs4))/{Vr}))
B§Rh106 N048 N076 V=abs(I(Rh106))*(0.5k*abs((-V(VA59)+V(gs4))/{abs(Vr)}))
Dp126 N076 N5I DiodeNRD2
Dp127 N5I N082 DiodeNRD2
R112 N052 0 1k
R115 N048 0 1k
S8 N5I VA59 N5 0 MYSW3
S9 N4 N090 N1 0 MYSW2
S10 N090 N091 gs4 0 MYSW1
S6 N5 N089 gs5 0 MYSW4
B§Rh107 N081 N052 V=abs(I(Rh108))*(0.5k*abs((V(VA59)-V(gs4))/{Vr}))
B§Rh108 N048 N075 V=abs(I(Rh108))*(0.5k*abs((-V(VA59)+V(gs4))/{abs(Vr)}))
Dp128 N075 N5I DiodeNRD2
Dp129 N5I N081 DiodeNRD2
R10 N052 0 1k
R109 N048 0 1k
Vd3 ds6 0 0.5V
B§Id3 ds6 Rsw4a I=if (V(gs6)-V(T6)>V(ds6),  Km*(2*(V(gs6)-V(T6))-V(ds6))*V(ds6), (if ( V(gs6)>V(T6), Km*(V(gs6)-V(T6))*(V(gs6)-V(T6)), 0)))
C23 gs6 M6 {c1}
C24 M6 0 {c2}
Dp132 N105 gs6 DiodeNRD
Rs22 N105 N104 400Meg
Rr11 gs6 M6 29Meg
RM11 M6 0 300Meg
B§VT6 T6 0 V=VT0*(1-f*abs(V(M6))/{VT0})
Dp133 gs6 N101 DiodeNRD
Rs23 N101 N100 600Meg
R116 N104 0 1k
B§Rh111 N149 N104 V=abs(I(Rh111))*(1k*abs((V(N3)-V(gs6))/{V}))
B§Rh112 N100 N141 V=abs(I(Rh112))*(1k*abs((-V(N3)+V(gs6))/{abs(V)}))
Dp138 N141 N140 DiodeNRD2
Dp139 N140 N149 DiodeNRD2
R117 N100 0 1k
Rsw4 Rsw4a Rsw4b 0.5
RN4 Rsw4b 0 0.5
Vd6 ds7 0 0.5V
B§Id6 ds7 Rsw7a I=if (V(gs7)-V(T7)>V(ds7),  Km*(2*(V(gs7)-V(T7))-V(ds7))*V(ds7), (if ( V(gs7)>V(T7), Km*(V(gs7)-V(T7))*(V(gs7)-V(T7)), 0)))
C29 gs7 M7 {c1}
C30 M7 0 {c2}
Dp142 N107 gs7 DiodeNRD
Rs28 N107 N106 400Meg
Rr14 gs7 M7 29Meg
RM14 M7 0 300Meg
B§VT7 T7 0 V=VT0*(1-f*abs(V(M7))/{VT0})
Dp143 gs7 N103 DiodeNRD
Rs29 N103 N102 600Meg
R118 N106 0 1k
B§Rh115 N150 N106 V=abs(I(Rh115))*(1k*abs((V(N3)-V(gs7))/{V}))
B§Rh116 N102 N142 V=abs(I(Rh116))*(1k*abs((-V(N3)+V(gs7))/{abs(V)}))
Dp144 N142 N3 DiodeNRD2
Dp145 N3 N150 DiodeNRD2
R119 N102 0 1k
Rsw7 Rsw7a Rsw7b 0.5
RN7 Rsw7b 0 0.5
VA55 N155 0 PULSE(0 {V2} 0 0.01 0.01 0.23 0.5 12000)
R120 N6 0 1Meg
W5 N153 VA57 VIN7 MCSW2
VA57 VA57 0 PULSE(0 {V2} 0 0.01 0.01 0.23 0.5 12000)
R121 N7 0 1Meg
VA60 VA60 0 PULSE(0 {Vr} 0 0 0 0.25 0.5 12000)
B§Rh117 N145 N104 V=abs(I(Rh117))*(0.75k*abs((V(VA60)-V(gs6))/{Vr}))
B§Rh118 N100 N137 V=abs(I(Rh118))*(0.75k*abs((-V(VA60)+V(gs6))/{abs(Vr)}))
Dp146 N137 N5I DiodeNRD2
Dp147 N5I N145 DiodeNRD2
R122 N104 0 1k
R123 N100 0 1k
S7 N5I VA60 N7 0 MYSW3
S13 N146 N153 gs7 0 MYSW7
S14 N3 N140 N7 0 MYSW9
S15 N154 N155 gs6 0 MYSW5
S11 N6 N154 N3 0 MYSW6
S12 N7 N146 N3 0 MYSW9
VA2a VA2 N038 PULSE(0 {V} {t5a} 0.03 0.03 0.25 0.5 100)
VA7a VA7 N039 PULSE(0 {V1} {t5a} 0.03 0.03 0.25 0.5 200)
.model D D
.lib standard.dio
.tran 2900
.param Vr=-6 V=9 V1=9 V2=9
.model DiodeNRD D (Ron=.1 Roff=100T Vfwd=0.3)
.params W=50e-9 L=8e-6 d= 30e-9 mun=0.08 lambda=0.03
.param VT0=0.28V
.param cgsm=c1*c2/(c1+c2)  Km=(1/2)*8*(W/L)*mun*cgsm/(L*L)
.param f=.1
.params c1=0.0000009u c2=.7u
.model DiodeNRD2 D (Ron=.1 Roff=100T Vfwd=0)
.model MYSW SW(Ron=1 Roff=100Meg Vt=0.225 Vh=0)
* SOMA
.model MCSW CSW(Ron=0.1 Roff=1000Meg It=0.677u Ih=0)
VIN1 Rsw1a Rsw1b 0
VIN2 Rsw2a Rsw2b 0
* N1 - silent synapse
* N1' - normal synapses
* N2 - Inhibitive regulation
* SOMA
* SOMA
* SOMA
* SOMA
* SOMA
* s5
* s15
* s11
* s6
* s3
* s1
* s16
* s12
* s7
* s8
* s4
* s17
* s18
* s13
* s14
* s9
* s19
* s5
* SOMA
* SOMA
* SOMA
* SOMA
* s15
* s11
* s6
* s3
* s1
* s16
* s12
* s7
* s8
* s4
* s17
* s18
* s13
* s14
* s9
* s19
.param t1=6000 t2=6000 t3=6000 t4=6000 t5=6000 t6=6000 t7=6000 t8=6000 t9=0 t10=6000
.param t6a=6000 t3a=6000 t16a=6000 t12a=6000 t7a=6000 t8a=6000 t18a=6000 t13a=6000 t5a=6000
.param t11=6000 t12=6000 t13=200 t14=100 t15=6000 t16=6000 t17=400 t18=300 t19=6000
* s10
* s2
* s10
* s2
VIN3 Rsw3a Rsw3b 0
.model MCSW1 CSW(Ron=0.1 Roff=1000Meg It=11.244u Ih=0)
* N3'- (N1)Minor selectivity
* N3- (N1)Major selectivity
.model MYSW1 SW(Ron=1 Roff=1T Vt=0.233 Vh=0)
VIN5 Rsw6a Rsw6b 0
.model MYSW3 SW(Ron=1 Roff=100Meg Vt=0.01 Vh=0)
.model MYSW2 SW(Ron=1T Roff=1 Vt=10u Vh=0)
.model MYSW4 SW(Ron=1 Roff=1T Vt=0.871 Vh=0)
.model MCSW2 CSW(Ron=0.1 Roff=1000Meg It=1.23726u Ih=0)
* N4'- (N3)Minor selectivity
* N4- (N3)Major selectivity
.model MYSW5 SW(Ron=1 Roff=1T Vt=0.1289554 Vh=0)
VIN7 Rsw7a Rsw7b 0
.model MYSW3 SW(Ron=1 Roff=100Meg Vt=0.01 Vh=0)
.model MYSW6 SW(Ron=1000T Roff=1 Vt=3.2u vh=0)
.model MYSW7 SW(Ron=1 Roff=1T Vt=0.4699 Vh=0)
.model MYSW9 SW(Ron=100T Roff=1 Vt=20u Vh=0)
* N1E
* N3I
* N1E
* N1E
* N240deg
* N210deg
* N2E
* N2E
* N2E
* N60deg
* N30deg
.backanno
.end